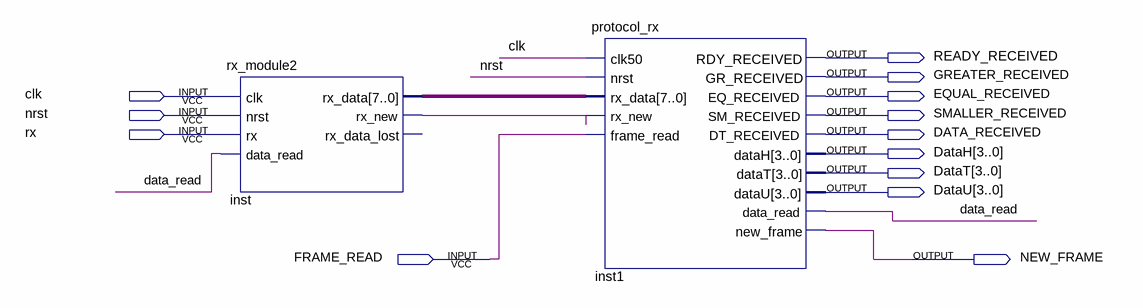
[diagram p0: schematic sheet]
// Quartus schematic RXmodule.bdf as structural Verilog: 2 symbols, 13 pins
module RXmodule (
  input  clk,
  input  nrst,
  input  rx,
  input  FRAME_READ,
  output READY_RECEIVED,
  output GREATER_RECEIVED,
  output EQUAL_RECEIVED,
  output SMALLER_RECEIVED,
  output DATA_RECEIVED,
  output [3:0] DataH,
  output [3:0] DataT,
  output [3:0] DataU,
  output NEW_FRAME
);

  wire data_read, inst_rx_new;
  wire [7:0] inst_rx_data;

  rx_module2 inst (
    .clk(clk), .nrst(nrst), .rx(rx), .data_read(data_read), .rx_data(inst_rx_data), .rx_new(inst_rx_new));  // open: rx_data_lost
  protocol_rx inst1 (
    .clk50(clk), .nrst(nrst), .rx_data(inst_rx_data), .rx_new(inst_rx_new), .frame_read(FRAME_READ),
    .RDY_RECEIVED(READY_RECEIVED), .GR_RECEIVED(GREATER_RECEIVED), .EQ_RECEIVED(EQUAL_RECEIVED),
    .SM_RECEIVED(SMALLER_RECEIVED), .DT_RECEIVED(DATA_RECEIVED), .dataH(DataH), .dataT(DataT), .dataU(DataU),
    .data_read(data_read), .new_frame(NEW_FRAME));
endmodule
